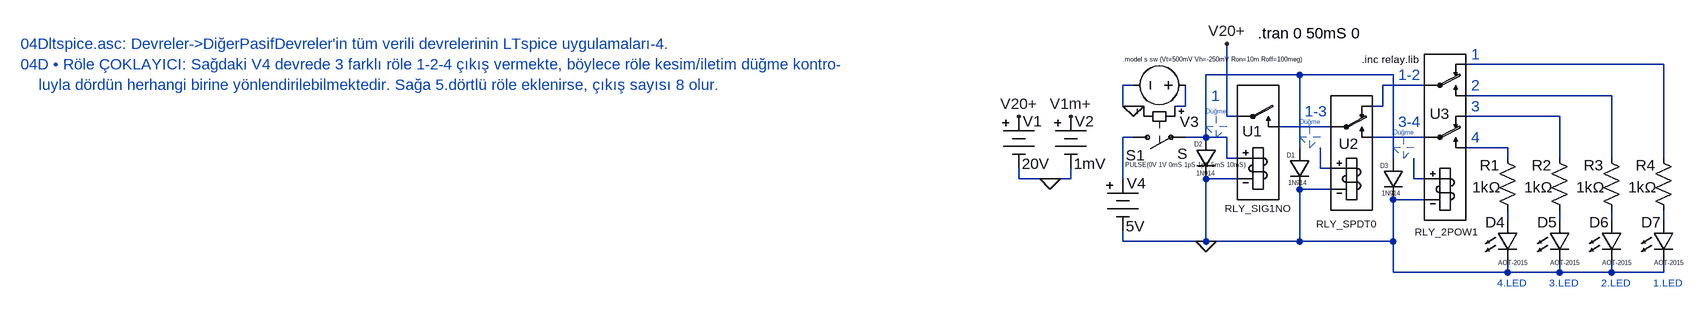
[diagram p0: schematic 04Dltspice.asc]
04Dltspice.asc, the LTspice schematic file:
Version 4
SHEET 1 3332 2492
WIRE 1744 80 1440 80
WIRE 1184 96 1040 96
WIRE 1328 96 1184 96
WIRE 928 112 912 112
WIRE 1376 112 1312 112
WIRE 1664 128 1440 128
WIRE 912 144 912 112
WIRE 928 144 912 144
WIRE 944 144 928 144
WIRE 1008 144 1008 112
WIRE 1008 144 992 144
WIRE 1312 144 1312 112
WIRE 1312 144 1296 144
WIRE 1072 160 1072 48
WIRE 1088 160 1072 160
WIRE 1584 160 1440 160
WIRE 1232 176 1152 176
WIRE 928 192 912 192
WIRE 1040 192 1040 96
WIRE 1040 192 1008 192
WIRE 1072 192 1040 192
WIRE 1376 192 1296 192
WIRE 1184 208 1184 96
WIRE 1504 208 1440 208
WIRE 1072 224 1072 192
WIRE 1088 224 1072 224
WIRE 1328 224 1328 96
WIRE 1504 224 1504 208
WIRE 1584 224 1584 160
WIRE 1664 224 1664 128
WIRE 1744 224 1744 80
WIRE 1216 240 1216 208
WIRE 1232 240 1216 240
WIRE 752 256 752 240
WIRE 800 256 752 256
WIRE 832 256 832 240
WIRE 832 256 800 256
WIRE 912 256 912 192
WIRE 1088 256 1040 256
WIRE 1360 256 1360 224
WIRE 1376 256 1360 256
WIRE 1232 272 1184 272
WIRE 1376 288 1328 288
WIRE 1504 320 1504 304
WIRE 1584 320 1584 304
WIRE 1664 320 1664 304
WIRE 1744 320 1744 304
WIRE 912 352 912 336
WIRE 1040 352 1040 256
WIRE 1040 352 912 352
WIRE 1184 352 1184 272
WIRE 1184 352 1040 352
WIRE 1328 352 1328 288
WIRE 1328 352 1184 352
WIRE 1328 400 1328 352
WIRE 1504 400 1504 384
WIRE 1504 400 1328 400
WIRE 1584 400 1584 384
WIRE 1584 400 1504 400
WIRE 1664 400 1664 384
WIRE 1664 400 1584 400
WIRE 1744 400 1744 384
WIRE 1744 400 1664 400
FLAG 752 160 V20+
FLAG 800 256 0
FLAG 832 160 V1m+
FLAG 928 144 0
FLAG 1040 352 0
FLAG 1072 48 V20+
SYMBOL Misc\\battery 752 144 R0
WINDOW 0 6 23 Left 2
WINDOW 3 5 89 Left 2
SYMATTR InstName V1
SYMATTR Value 20V
SYMBOL Misc\\battery 832 144 R0
WINDOW 0 6 23 Left 2
WINDOW 3 5 89 Left 2
SYMATTR InstName V2
SYMATTR Value 1mV
SYMBOL sw 912 192 M90
WINDOW 0 28 34 VLeft 2
WINDOW 3 25 100 VLeft 2
SYMATTR InstName S1
SYMATTR Value S
SYMBOL voltage 1024 112 M270
WINDOW 0 -56 -5 VRight 2
WINDOW 3 -122 -76 VRight 0
WINDOW 123 0 0 Left 0
WINDOW 39 0 0 Left 0
SYMATTR InstName V3
SYMATTR Value PULSE(0V 1V 0mS 1pS 1pS 5mS 10mS)
SYMBOL Misc\\battery 912 240 R0
WINDOW 0 6 23 Left 2
WINDOW 3 5 89 Left 2
SYMATTR InstName V4
SYMATTR Value 5V
SYMBOL diode 1200 208 M0
WINDOW 0 23 12 Left 0
WINDOW 3 4 54 Left 0
SYMATTR InstName D1
SYMATTR Value 1N914
SYMBOL rly_spst-no 1120 176 R0
WINDOW 0 -9 7 Center 2
WINDOW 3 -1 125 Center 1
SYMATTR InstName U1
SYMBOL diode 1056 192 M0
WINDOW 0 21 11 Left 0
WINDOW 3 1 55 Left 0
SYMATTR InstName D2
SYMATTR Value 1N914
SYMBOL rly_spdt 1264 192 R0
WINDOW 0 -20 10 Left 2
WINDOW 3 -54 133 Left 1
SYMATTR InstName U2
SYMBOL rly_dpdt 1408 208 R0
WINDOW 0 -8 -52 Center 2
WINDOW 3 1 129 Center 1
SYMATTR InstName U3
SYMBOL diode 1344 224 M0
WINDOW 0 23 12 Left 0
WINDOW 3 4 54 Left 0
SYMATTR InstName D3
SYMATTR Value 1N914
SYMBOL res 1520 320 R180
WINDOW 0 28 85 Left 2
WINDOW 3 26 51 Left 2
SYMATTR InstName R1
SYMATTR Value 1kΩ
SYMBOL LED 1488 320 R0
WINDOW 3 2 65 Left 0
WINDOW 0 -18 3 Left 2
SYMATTR Value AOT-2015
SYMATTR InstName D4
SYMATTR Description Diode
SYMATTR Type diode
SYMBOL res 1600 320 R180
WINDOW 0 28 85 Left 2
WINDOW 3 26 51 Left 2
SYMATTR InstName R2
SYMATTR Value 1kΩ
SYMBOL LED 1568 320 R0
WINDOW 3 2 65 Left 0
WINDOW 0 -18 3 Left 2
SYMATTR Value AOT-2015
SYMATTR InstName D5
SYMATTR Description Diode
SYMATTR Type diode
SYMBOL res 1680 320 R180
WINDOW 0 28 85 Left 2
WINDOW 3 26 51 Left 2
SYMATTR InstName R3
SYMATTR Value 1kΩ
SYMBOL LED 1648 320 R0
WINDOW 3 2 65 Left 0
WINDOW 0 -18 3 Left 2
SYMATTR Value AOT-2015
SYMATTR InstName D6
SYMATTR Description Diode
SYMATTR Type diode
SYMBOL res 1760 320 R180
WINDOW 0 28 85 Left 2
WINDOW 3 26 51 Left 2
SYMATTR InstName R4
SYMATTR Value 1kΩ
SYMBOL LED 1728 320 R0
WINDOW 3 2 65 Left 0
WINDOW 0 -18 3 Left 2
SYMATTR Value AOT-2015
SYMATTR InstName D7
SYMATTR Description Diode
SYMATTR Type diode
TEXT -784 48 Left 2 ;04Dltspice.asc: Devreler->DiğerPasifDevreler'in tüm verili devrelerinin LTspice uygulamaları-4.
TEXT -784 80 Left 2 ;04D • Röle ÇOKLAYICI: Sağdaki V4 devrede 3 farklı röle 1-2-4 çıkış vermekte, böylece röle kesim/iletim düğme kontro-\n    luyla dördün herhangi birine yönlendirilebilmektedir. Sağa 5.dörtlü röle eklenirse, çıkış sayısı 8 olur.
TEXT 912 72 Left 0 !.model s sw (Vt=500mV Vh=-250mV Ron=10m Roff=100meg)
TEXT 1120 32 Left 2 !.tran 0 50mS 0
TEXT 1488 416 Left 1 ;4.LED
TEXT 1568 416 Left 1 ;3.LED
TEXT 1648 416 Left 1 ;2.LED
TEXT 1728 416 Left 1 ;1.LED
TEXT 1448 64 Left 2 ;1
TEXT 1448 112 Left 2 ;2
TEXT 1448 144 Left 2 ;3
TEXT 1448 192 Left 2 ;4
TEXT 1336 96 Left 2 ;1-2
TEXT 1336 168 Left 2 ;3-4
TEXT 1192 152 Left 2 ;1-3
TEXT 1048 128 Left 2 ;1
TEXT 1280 72 Left 1 !.inc relay.lib
TEXT 1328 184 Left 0 ;Düğme
TEXT 1040 152 Left 0 ;Düğme
TEXT 1184 168 Left 0 ;Düğme
LINE Normal 1344 224 1344 192 2
LINE Normal 1328 208 1344 224 2
LINE Normal 1360 208 1328 208 2
LINE Normal 1344 224 1360 208 2
LINE Normal 1056 192 1056 160 2
LINE Normal 1040 176 1056 192 2
LINE Normal 1072 176 1040 176 2
LINE Normal 1056 192 1072 176 2
LINE Normal 1200 208 1200 176 2
LINE Normal 1184 192 1200 208 2
LINE Normal 1216 192 1184 192 2
LINE Normal 1200 208 1216 192 2

The netlist it stands for:
* 04Dltspice.asc
V1 V20+ 0 20V
V2 V1m+ 0 1mV
S1 N008 N002 N005 0 S
V3 N005 0 PULSE(0V 1V 0mS 1pS 1pS 5mS 10mS)
V4 N008 0 5V
D1 N002 0 1N914
XU1 N002 0 V20+ N007 RLY_SIG1NO VNOM=5 RCOIL=500 VON=0.8 VOFF=0.4 RON=0.1 ROFF=1G COFF=1f LSER=1f CCOUP=1f TON=1m TOFF=1m LCOIL=10m CCOIL=1f  ; pins L+ L- SIN SON
D2 N002 0 1N914
XU2 N011 0 N007 N009 N003 RLY_SPDT0  ; pins L+ L- SIN SON SOFF
XU3 N012 0 N009 N010 N006 N003 N004 N001 RLY_2POW1 RLY_2POW1 VNOM=5 RCOIL=500 VON=0.8 VOFF=0.4 RON=0.1 ROFF=1G COFF=1f LSER=1f CCOUP=1f TON=1m TOFF=1m LCOIL=10m CCOIL=1f  ; pins L+ L- SIN1 SON1 SOFF1 SIN2 SON2 SOFF2
D3 N002 0 1N914
R1 N013 N010 1kΩ
D4 N013 0 AOT-2015
R2 N014 N006 1kΩ
D5 N014 0 AOT-2015
R3 N015 N004 1kΩ
D6 N015 0 AOT-2015
R4 N016 N001 1kΩ
D7 N016 0 AOT-2015
.model D D
.lib standard.dio
* 04Dltspice.asc: Devreler->DiğerPasifDevreler'in tüm verili devrelerinin LTspice uygulamaları-4.
* 04D • Röle ÇOKLAYICI: Sağdaki V4 devrede 3 farklı röle 1-2-4 çıkış vermekte, böylece röle kesim/iletim düğme kontro-
*     luyla dördün herhangi birine yönlendirilebilmektedir. Sağa 5.dörtlü röle eklenirse, çıkış sayısı 8 olur.
.model s sw (Vt=500mV Vh=-250mV Ron=10m Roff=100meg)
.tran 0 50mS 0
* 4.LED
* 3.LED
* 2.LED
* 1.LED
* 1
* 2
* 3
* 4
* 1-2
* 3-4
* 1-3
* 1
.inc relay.lib
* Düğme
* Düğme
* Düğme
.lib relay.lib
.backanno
.end